# Altium project uECG.PrjPcb
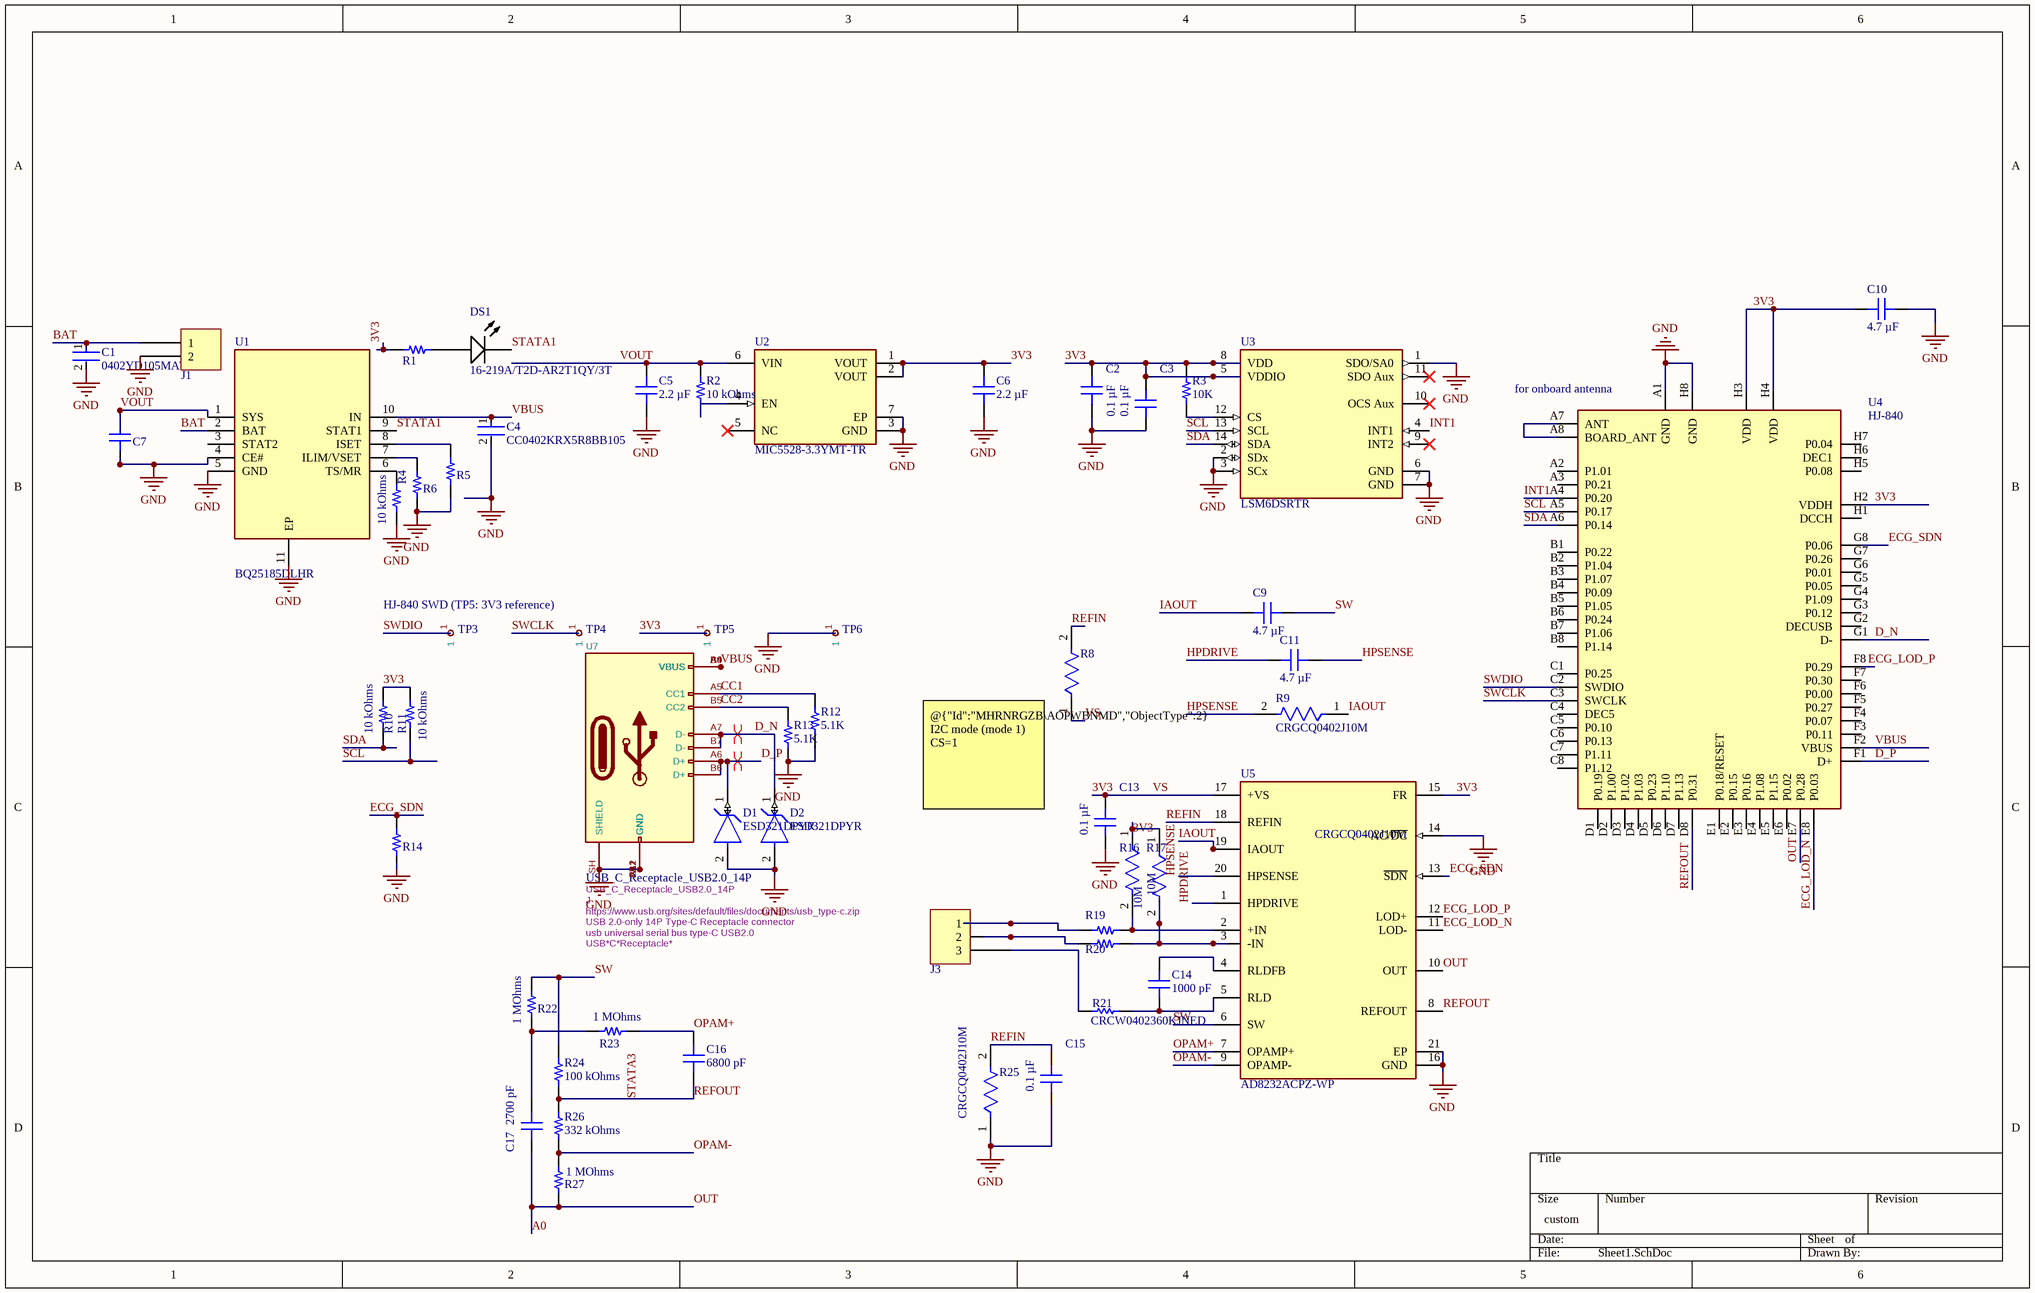
[diagram p0: Sheet1.SchDoc]
1 sheet, 54 parts. Net scope: global (net labels, ports and power ports of the same name join across sheets).
Board file: uECG.PcbDoc

## Sheet Sheet1.SchDoc
size 381 x 241 mm; SheetNumber: 1; SheetTotal: 1

### Parts
C1  0402YD105MAT2A  [FP-0402-L_1_0_1-W_0_5_0_1-MFG]
C2  0.1 µF  [CAP 0402_1005]
C3  0.1 µF  [CAP 0402_1005]
C4  CC0402KRX5R8BB105  [FP-CC0402-MFG]
C5  2.2 µF  [CAP 0603_1608]
C6  2.2 µF  [CAP 0603_1608]
C7  10 µF  [CAP 0603_1608]  (value not drawn)
C9  4.7 µF  [CAP 0402_1005]
C10  4.7 µF  [CAP 0402_1005]
C11  4.7 µF  [CAP 0402_1005]
C13  0.1 µF  [CAP 0402_1005]
C14  1000 pF  [CAP 0402_1005]
C15  0.1 µF  [CAP 0402_1005]
C16  6800 pF  [CAP 0402_1005]
C17  2700 pF  [CAP 0402_1005]
D1  ESD321DPYR  [FP-DPY0002A-MFG]
D2  ESD321DPYR  [FP-DPY0002A-MFG]
DS1  16-219A/T2D-AR2T1QY/3T  [EVRL-0402-2_V]
J1  0705530106  [MOLEX SDA-70553-2PIN]  (value not drawn)
J3  0705530002  [MOLEX SDA-70553-3PIN]  (value not drawn)
R1  1 kOhms  [RES 0402_1005]  (value not drawn)
R2  10 kOhms  [RES 0402_1005]
R3  10K  [RES 0402_1005]
R4  10 kOhms  [RES 0402_1005]
R5  3 kOhms  [RES 0402_1005]  (value not drawn)
R6  18 kOhms  [RES 0402_1005]  (value not drawn)
R8  CRGCQ0402J10M  [FP-CRGCQ0402-IPC_C]
R9  CRGCQ0402J10M  [FP-CRGCQ0402-IPC_C]
R10  10 kOhms  [RES 0402_1005]
R11  10 kOhms  [RES 0402_1005]
R12  5.1K  [RES 0402_1005]
R13  5.1K  [RES 0402_1005]
R14  100 kOhms  [RES 0402_1005]  (value not drawn)
R16  10M  [FP-CRGCQ0402-IPC_C]
R17  10M  [FP-CRGCQ0402-IPC_C]
R19  330 kOhms  [RES 0402_1005]  (value not drawn)
R20  330 kOhms  [RES 0402_1005]  (value not drawn)
R21  CRCW0402360KJNED  [RESC1005X40X25ML05T05]
R22  1 MOhms  [RES 0402_1005]
R23  1 MOhms  [RES 0402_1005]
R24  100 kOhms  [RES 0402_1005]
R25  CRGCQ0402J10M  [FP-CRGCQ0402-IPC_C]
R26  332 kOhms  [RES 0402_1005]
R27  1 MOhms  [RES 0402_1005]
TP3  TestPoint_Small  [TestPoint_Pad_D1.0mm]  (value not drawn)
TP4  TestPoint_Small  [TestPoint_Pad_D1.0mm]  (value not drawn)
TP5  TestPoint_Small  [TestPoint_Pad_D1.0mm]  (value not drawn)
TP6  TestPoint_Small  [TestPoint_Pad_D1.0mm]  (value not drawn)
U1  BQ25185DLHR  [WSON-10_L2.2-W2.0-P0.40-BL-EP_TI_DLH0010A]
U2  MIC5528-3.3YMT-TR  [FP-TDFN1212-6LD-PL-1-MFG]
U3  LSM6DSRTR  [FP-LGA-14L-DM00249496-MFG]
U4  HJ-840  [LGA-64_L7.0-W6.2-P0.90-R8-C8-S0.65-BL]
U5  AD8232ACPZ-WP  [FP-CP-20-8-IPC_A]
U7  USB_C_Receptacle_USB2.0_14P  Reference: J  ki_keywords: usb universal serial bus type-C USB2.0  ki_fp_filters: USB*C*Receptacle*  [USB_C_Receptacle_HRO_TYPE-C-31-M-12]

### Nets
GND: C1.2 C2.1 C3.1 C4.2 C5.1 C6.1 C7.1 C10.2 C13.1 C15.1 D1.2(GND) D2.2(GND) J1.2 R4.1 R5.1 R6.1 R12.1 R13.1 R14.1 R25.1 TP6.1 U1.4(CE#) U1.5(GND) U1.11(EP) U2.3(GND) U2.7(EP) U3.1(SDO/SA0) U3.2(SDx) U3.3(SCx) U3.6(GND) U3.7(GND) U4.A1(GND) U4.H8(GND) U5.14(AC/~{DC}) U5.16(GND) U5.21(EP) U7.A1(GND) U7.A12(GND) U7.B1(GND) U7.B12(GND) U7.SH(SHIELD)
3V3: C2.2 C3.2 C6.2 C10.1 C13.2 R1.1 R3.1 R8.1 R10.2 R11.2 R16.1 R17.1 TP5.1 U2.1(VOUT) U2.2(VOUT) U3.5(VDDIO) U3.8(VDD) U4.H2(VDDH) U4.H3(VDD) U4.H4(VDD) U5.15(FR) U5.17(+VS)  [also labelled VS]
A0: C17.1 R27.1 U4.E7(P0.28) U5.10(OUT)  [also labelled OUT]
BAT: C1.1 J1.1 U1.2(BAT)
CC1: R12.2 U7.A5(CC1)
CC2: R13.2 U7.B5(CC2)
D_N: D2.1(IO) U4.G1(D-) U7.A7(D-) U7.B7(D-)
D_P: D1.1(IO) U4.F1(D+) U7.A6(D+) U7.B6(D+)
ECG_LOD_N: U4.E8(P0.03) U5.11(LOD-)
ECG_LOD_P: U4.F8(P0.29) U5.12(LOD+)
ECG_SDN: R14.2 U4.G8(P0.06) U5.13(~{SDN})
HPDRIVE: C11.1 U5.1(HPDRIVE)
HPSENSE: C11.2 R9.2 U5.20(HPSENSE)
IAOUT: C9.1 R9.1 U5.19(IAOUT)
INT1: U3.4(INT1) U4.A4(P0.20)
OPAM+: C16.2 R23.2 U5.7(OPAMP+)
OPAM-: R26.1 R27.2 U5.9(OPAMP-)
REFIN: C15.2 R8.2 R25.2 U5.18(REFIN)
REFOUT: C16.1 R24.1 R26.2 U4.D8(P0.31) U5.8(REFOUT)  [also labelled STATA3]
SCL: R11.1 U3.13(SCL) U4.A5(P0.17)
SDA: R10.1 U3.14(SDA) U4.A6(P0.14)
STATA1: DS1.2(K) U1.9(STAT1)
SW: C9.2 R22.2 R24.2 U5.6(SW)
SWCLK: TP4.1 U4.C3(SWCLK)
SWDIO: TP3.1 U4.C2(SWDIO)
VBUS: C4.1 U1.10(IN) U4.F2(VBUS) U7.A4(VBUS) U7.A9(VBUS) U7.B4(VBUS) U7.B9(VBUS)
VOUT: C5.2 C7.2 R2.2 U1.1(SYS) U2.6(VIN)
NetC14_1: C14.1 R21.1 U5.5(RLD)
NetC14_2: C14.2 U5.4(RLDFB)
NetC17_2: C17.2 R22.1 R23.1
NetDS1_1: DS1.1(A) R1.2
NetJ3_1: J3.1 R19.1
NetJ3_2: J3.2 R20.1
NetJ3_3: J3.3 R21.2
NetR2_1: R2.1 U2.4(EN)
NetR3_2: R3.2 U3.12(CS)
NetR4_2: R4.2 U1.6(TS/MR)
NetR5_2: R5.2 U1.8(ISET)
NetR6_2: R6.2 U1.7(ILIM/VSET)
NetR16_2: R16.2 R19.2 U5.2(+IN)
NetR17_2: R17.2 R20.2 U5.3(-IN)
NetU4_A7: U4.A7(ANT) U4.A8(BOARD_ANT)

Not connected (* = marked no-connect by the designer): U1 3(STAT2); U2 5(NC)*; U3 9(INT2)* 10(OCS_Aux)* 11(SDO_Aux)*; U4 A2(P1.01) A3(P0.21) B1(P0.22) B2(P1.04) B3(P1.07) B4(P0.09) B5(P1.05) B6(P0.24) B7(P1.06) B8(P1.14) C1(P0.25) C4(DEC5) C5(P0.10) C6(P0.13) C7(P1.11) C8(P1.12) D1(P0.19) D2(P1.00) D3(P1.02) D4(P1.03) D5(P0.23) D6(P1.10) D7(P1.13) E1(P0.18/RESET) E2(P0.15) E3(P0.16) E4(P1.08) E5(P1.15) E6(P0.02) F3(P0.11) F4(P0.07) F5(P0.27) F6(P0.00) F7(P0.30) G2(DECUSB) G3(P0.12) G4(P1.09) G5(P0.05) G6(P0.01) G7(P0.26) H1(DCCH) H5(P0.08) H6(DEC1) H7(P0.04)

### Layout directives
differential pair: D_N, D_P

### Notes on the sheet
- (near U4) for onboard antenna
- HJ-840 SWD (TP5: 3V3 reference)
- (near R8) @{"Id":"MHRNRGZB\AOPWBNMD","ObjectType":2} I2C mode (mode 1) CS=1

### Library data of the parts
C1 = CMP-04427-002736-1: General Purpose Ceramic Capacitor, 0402, 1uF, 20%, X5R, 15%, 16V; Tolerance: 20%; Case/Package: 0402; Min Operating Temperature: -55°C; Packaging: Tape and Reel; Dielectric: X5R; Capacitance: 1uF; Max Operating Temperature: 85°C; RoHS Compliant: Yes; Voltage Rating (DC): 16V; Package Quantity: 10000
C2 C3 C13 C15 = CL05B104KP5VPNC: CAP CER 100NF 10V X7R 0402; manufacturer: Samsung Electro-Mechanics; Tolerance: ±10%; Part Number: CL05B104KP5VPNC; Capacitance: 0.1 µF; Applications: Automotive; componentlink1description: Datasheet; componentlink1url: https://mm.digikey.com/Volume0/opasdata/d220001/medias/docus/5458/CL05B104KP5VPNC_Spec.pdf; componentlink2description: DigiKey Link; componentlink2url: https://www.digikey.com/en/products/detail/samsung-electro-mechanics/CL05B104KP5VPNC/20498482; Device Package: 0402 (1005 Metric); Features: General Purpose; lastupdated: 06-04-2026 19:07:45; Lifecycle Status: Active; Minimum Order: 1; Mounting Type: Surface Mount, MLCC, Epoxy; Operating Temperature: -55°C ~ 125°C; Package / Case: 0402 (1005 Metric); packaging: TapeAndReel; partid: 56690; price: 0.01; Ratings: AEC-Q200; series: CL; Size / Dimension: 0.039" L x 0.020" W (1.00mm x 0.50mm); Supplier 1: DigiKey; Supplier Part Number 1: 1276-CL05B104KP5VPNCCT-ND; Temperature Coefficient: X7R; Thickness (Max): 0.022" (0.55mm); value: 0.1 µF; Voltage - Rated: 10V
C4 = CMP-03422-000114-1: CAP CER 1UF 25V X5R 0402; Manufacturer: YAGEO; Automotive Grade: NA; Tolerance: 0.1; Material: Ceramic; Temperature Coefficient: 30ppm/°C; RoHS: TRUE; Voltage Rating: 25 V; Footprint Url: http://www.yageo.com/exep/pages/download/literatures/UPY-C_GEN_24.pdf; Height: 0.55mm; Package: CC0402; Lead Free: Yes; Category: Cap; Device Class L1: Passive Components; ComponentLink2Description: Datasheet; Manufacturer Part Number: CC0402KRX5R8BB105; Value: 1 uF; Automotive: No; Capacitance: 1 uF; Temperature Characteristic: X5R; Temperature Range High: +125°C; Device Class L2: Capacitors; ComponentLink2URL: http://www.yageo.com/documents/recent/UPY-GP_NP0_16V-to-50V_16.pdf; Temperature Range Low: -55°C; Temperature: -55°C to +125°C; Ipc Land Pattern Name: CAPC10050X50; Device Class L3: Ceramic Capacitors; Digikey Description: CAP CER 1UF 25V X5R 0402; Octopart: https://octopart.com/cc0402krx5r8bb105-yageo-57080749; Mouser Description: Multilayer Ceramic Capacitors MLCC - SMD/SMT 1M pF 10% 25 Volts
C5 C6 = GRM188R61E225KA12D: CAP CER 2.2UF 16V X5R 0402; Part Number: CL05A225KO5NQNC; manufacturer: Samsung Electro-Mechanics; Tolerance: ±10%; id: 34; Capacitance: 2.2 µF; Applications: General Purpose; componentlink1description: Datasheet; componentlink1url: http://www.samsungsem.com/kr/support/product-search/mlcc/CL05A225KO5NQNC.jsp; componentlink2description: DigiKey Link; componentlink2url: https://www.digikey.com/en/products/detail/samsung-electro-mechanics/CL05A225KO5NQNC/3887119; Device Package: 0402 (1005 Metric); lastupdated: 2023-01-03T20:04:20.330; Lifecycle Status: Active; Minimum Order: 1; Mounting Type: Surface Mount, MLCC; Operating Temperature: -55°C ~ 85°C; Package / Case: 0402 (1005 Metric); packaging: TapeAndReel; partid: 1761; Part Status: Active; price: 0.03; series: CL; Size / Dimension: 0.039" L x 0.020" W (1.00mm x 0.50mm); Supplier 1: DigiKey; Supplier Part Number 1: 1276-1461-1-ND; Temperature Coefficient: X5R; Thickness (Max): 0.022" (0.55mm); value: 2.2 µF; Voltage - Rated: 16V
C7 = TMK107BBJ106MA-T: CAP CER 10UF 25V X5R 0603; Manufacturer: Taiyo Yuden; id: 1600; Tolerance: ±20%; Part Number: TMK107BBJ106MA-T; Value: 10 µF; Temperature Coefficient: X5R; Supplier Part Number 1: 587-6023-1-ND; ComponentLink2Description: DigiKey Link; ComponentLink1URL: https://ds.yuden.co.jp/TYCOMPAS/ut/detail?pn=TMK107BBJ106MA-T &u=M; PartId: 8967; Supplier 1: DigiKey; Series: M; LastUpdated: 2023-01-03T20:07:28.623; Part Status: Active; Capacitance: 10 µF; Device Package: 0603 (1608 Metric); Thickness (Max): 0.039" (1.00mm); Voltage - Rated: 25V; Minimum Order: 1; Packaging: TapeAndReel; Applications: SMPS Filtering; Package / Case: 0603 (1608 Metric); ComponentLink1Description: Datasheet; Price: 0.07; ComponentLink2URL: https://www.digikey.com/en/products/detail/taiyo-yuden/TMK107BBJ106MA-T/7403921; Lifecycle Status: Active; Operating Temperature: -55°C ~ 85°C; Size / Dimension: 0.063" L x 0.031" W (1.60mm x 0.80mm); Mounting Type: Surface Mount, MLCC
C9-C11 = CL05A475MO5NUNC: CAP CER 4.7UF 16V X5R 0402; manufacturer: Samsung Electro-Mechanics; Tolerance: ±20%; Part Number: CL05A475MO5NUNC; Capacitance: 4.7 µF; Applications: General Purpose; componentlink1description: Datasheet; componentlink1url: http://www.samsungsem.com/kr/support/product-search/mlcc/__icsFiles/afieldfile/2019/05/29/Data%20sheet_CL05A475MO5NUNC.pdf; componentlink2description: DigiKey Link; componentlink2url: https://www.digikey.com/en/products/detail/samsung-electro-mechanics/CL05A475MO5NUNC/5961320; Device Package: 0402 (1005 Metric); lastupdated: 06-04-2026 19:11:12; Lifecycle Status: Active; Minimum Order: 1; Mounting Type: Surface Mount, MLCC; Operating Temperature: -55°C ~ 85°C; Package / Case: 0402 (1005 Metric); packaging: TapeAndReel; partid: 1760; Part Status: Active; price: 0.07; series: CL; Size / Dimension: 0.039" L x 0.020" W (1.00mm x 0.50mm); Supplier 1: DigiKey; Supplier Part Number 1: 1276-6836-1-ND; Temperature Coefficient: X5R; Thickness (Max): 0.028" (0.70mm); value: 4.7 µF; Voltage - Rated: 16V
C14 = C0402C102K1GECAUTO: CAP CER 0402 1NF 100V C0G 10%; manufacturer: KEMET; Temperature Coefficient: C0G, NP0; Part Number: C0402C102K1GECAUTO; Capacitance: 1000 pF; Applications: Automotive, ESD Protection; componentlink1description: Datasheet; componentlink1url: https://api.kemet.com/component-edge/download/datasheet/C0402C102K1GECAUTO.pdf; componentlink2description: DigiKey Link; componentlink2url: https://www.digikey.com/en/products/detail/kemet/C0402C102K1GECAUTO/8563696; Device Package: 0402 (1005 Metric); Features: Low ESL, Low ESR; lastupdated: 06-04-2026 19:10:35; Lifecycle Status: Active; Minimum Order: 1; Mounting Type: Surface Mount, MLCC; Operating Temperature: -55°C ~ 125°C; Package / Case: 0402 (1005 Metric); packaging: TapeAndReel; partid: 10371; Part Status: Active; price: 0.02; Ratings: AEC-Q200; series: ESD SMD Auto C0G; Size / Dimension: 0.039" L x 0.020" W (1.00mm x 0.50mm); Supplier 1: DigiKey; Supplier Part Number 1: 399-17168-1-ND; Thickness (Max): 0.022" (0.55mm); Tolerance: ±10%; value: 1000 pF; Voltage - Rated: 100V
C16 = C0402C682K5RECAUTO: CAP CER 0402 6.8NF 50V X7R 10%; manufacturer: KEMET; Part Number: C0402C682K5RECAUTO; Capacitance: 6800 pF; Applications: Automotive, ESD Protection; componentlink1description: Datasheet; componentlink1url: https://api.kemet.com/component-edge/download/datasheet/C0402C682K5RECAUTO.pdf; componentlink2description: DigiKey Link; componentlink2url: https://www.digikey.com/en/products/detail/kemet/C0402C682K5RECAUTO/8646476; Device Package: 0402 (1005 Metric); lastupdated: 06-04-2026 19:10:09; Lifecycle Status: Active; Minimum Order: 1; Mounting Type: Surface Mount, MLCC; Operating Temperature: -55°C ~ 125°C; Package / Case: 0402 (1005 Metric); packaging: TapeAndReel; partid: 33549; Part Status: Active; price: 0.01; Ratings: AEC-Q200; series: ESD SMD Auto X7R; Size / Dimension: 0.039" L x 0.020" W (1.00mm x 0.50mm); Supplier 1: DigiKey; Supplier Part Number 1: 399-C0402C682K5RECAUTOCT-ND; Temperature Coefficient: X7R; Thickness (Max): 0.022" (0.55mm); Tolerance: ±10%; value: 6800 pF; Voltage - Rated: 50V
C17 = C0402C272K4RAC7867: CAP CER 2700PF 16V X7R 0402; manufacturer: KEMET; Tolerance: ±10%; Part Number: C0402C272K4RAC7867; Capacitance: 2700 pF; Applications: Bypass, Decoupling; componentlink1description: Datasheet; componentlink1url: https://api.kemet.com/component-edge/download/datasheet/C0402C272K4RACTU.pdf; componentlink2description: DigiKey Link; componentlink2url: https://www.digikey.com/en/products/detail/kemet/C0402C272K4RAC7867/2196549; Device Package: 0402 (1005 Metric); lastupdated: 06-04-2026 19:11:02; Lifecycle Status: Active; Minimum Order: 1; Mounting Type: Surface Mount, MLCC; Operating Temperature: -55°C ~ 125°C; Package / Case: 0402 (1005 Metric); packaging: TapeAndReel; partid: 3725; Part Status: Active; price: 0.06; series: SMD Comm X7R; Size / Dimension: 0.039" L x 0.020" W (1.00mm x 0.50mm); Supplier 1: DigiKey; Supplier Part Number 1: 399-17379-1-ND; Temperature Coefficient: X7R; Thickness (Max): 0.022" (0.55mm); value: 2700 pF; Voltage - Rated: 16V
D1 D2 = CMP-04989-000001-1: HDMI2.0 ESD PROTECTION; Manufacturer: Texas Instruments; Standoff Height: 0mm; Peak Pulse Current: 6A; Value: 0.9pF; Number Of Channels: 1; Reverse Standoff Voltage: 3.6V; Peak Pulse Power: 40W; Breakdown Voltage: 4.5V; Direction: Unidirectional; Clamping Voltage: 6.8V; RoHS: TRUE; Temperature: -40°C to +125°C; Package: DPY0002A; Temperature Range Low: -40°C; Temperature Range High: +125°C; Category: Diode; Capacitance: 0.9pF; Ambient Temperature Range Low: -40°C; Device Class L3: unset; Device Class L1: Circuit Protection; Ambient Temperature Range High: +125°C; ComponentLink2URL: http://www.ti.com/lit/ds/symlink/esd321.pdf; Octopart: https://octopart.com/esd321dpyr-texas+instruments-94354200; Manufacturer Part Number: ESD321DPYR; Digikey Description: HDMI2.0 ESD PROTECTION; Lead Free: Yes; ComponentLink2Description: Datasheet; Device Class L2: TVS Diodes; Height: 0.45mm; Automotive: No
DS1 = CMP-2100-03575-1: Chip LED, White, 5 V, 10 mA, 30 mW, -40 to 85 degC, 2-Pin SMD (0402), RoHS, Tape and Reel; Manufacturer: Everlight Electronics; Power Rating: 30mW; Luminous Intensity: 360mcd; Forward Current: 5mA; Forward Voltage: 2.6V; Lens Colour: Yellow; Viewing Angle: 130degrees; Min Operating Temperature: -40degC; Datasheet URL: http://www.everlight.com/file/ProductFile/16-219A-T2D-AR2T1QY-3T.pdf; Case/Package: 0402; Package Description: 2-Pin Surface Mount Device, Body 1 x 0.5 mm; RoHSCompliant: true; Datasheet Version: Rev. 5, 04/2013; Max Operating Temperature: 85degC; Packaging: TapeandReel; Package Reference: 0402; Package Quantity: 3000; Manufacturer URL: http://www.everlight.com/; Illumination Colour: White; Mount: Standard
J1 = 0705530106: CONN HEADER R/A 2POS 2.54MM; Manufacturer: Molex; id: 85; Style: Board to Cable/Wire; Contact Length - Mating: 0.240" (6.10mm); Pitch - Mating: 0.100" (2.54mm); Number Of Positions: 2; Number Of Positions Loaded: All; Voltage Rating: 250V; Shrouding: Shrouded - 4 Wall; Material Flammability Rating: UL94 V-0; Contact Length - Post: 0.130" (3.30mm); Part Number: 0705530106; Supplier Part Number 1: WM4153-ND; Contact Shape: Square; Termination: Solder; ComponentLink1Description: Datasheet; Connector Type: Header; Contact Material: Phosphor Bronze; ComponentLink2URL: http://digikey.com/product-detail/en/molex/0705530106/WM4153-ND/1643386; Contact Finish - Mating: Gold; ComponentLink1URL: https://www.molex.com/pdm_docs/sd/705530106_sd.pdf; Fastening Type: Latch Holder; Supplier 1: DigiKey; Number Of Rows: 1; Series: SL 70553; Part Status: Active; ComponentLink2Description: DigiKey Link; Contact Type: Male Pin; Packaging: Tube; Insulation Height: 0.215" (5.45mm); Contact Finish - Post: Tin; Contact Finish Thickness - Mating: 30.0µin (0.76µm); Minimum Order: 1; PartId: 85; Lifecycle Status: Active; LastUpdated: 2020-01-12T23:55:40.060; Operating Temperature: -40°C ~ 105°C; Insulation Color: Black; Mounting Type: Through Hole, Right Angle; Insulation Material: Polyester, Glass Filled; Price: 1.38
J3 = 0705530002: CONN HEADER R/A 3POS 2.54MM; Manufacturer: Molex; id: 86; Style: Board to Cable/Wire; Contact Length - Mating: 0.240" (6.10mm); Pitch - Mating: 0.100" (2.54mm); Number Of Positions: 3; Number Of Positions Loaded: All; Voltage Rating: 250V; Shrouding: Shrouded - 4 Wall; Material Flammability Rating: UL94 V-0; Contact Length - Post: 0.130" (3.30mm); Part Number: 0705530002; Supplier Part Number 1: WM4901-ND; Contact Shape: Square; Termination: Solder; ComponentLink1Description: Datasheet; Connector Type: Header; Contact Material: Phosphor Bronze; ComponentLink2URL: http://digikey.com/product-detail/en/molex/0705530002/WM4901-ND/114955; Contact Finish - Mating: Gold; ComponentLink1URL: https://www.molex.com/pdm_docs/sd/705530002_sd.pdf; Fastening Type: Latch Holder; Supplier 1: DigiKey; Number Of Rows: 1; Series: SL 70553; Part Status: Active; ComponentLink2Description: DigiKey Link; Contact Type: Male Pin; Packaging: Tube; Insulation Height: 0.215" (5.45mm); Contact Finish - Post: Tin; Contact Finish Thickness - Mating: 15.0µin (0.38µm); Minimum Order: 1; PartId: 86; Lifecycle Status: Active; LastUpdated: 2020-01-12T23:55:55.763; Operating Temperature: -40°C ~ 105°C; Insulation Color: Black; Mounting Type: Through Hole, Right Angle; Insulation Material: Polyester, Glass Filled; Price: 1.02
R1 = CPF0402B1K0E: RES SMD 1K OHM 0.1% 1/16W 0402; Manufacturer: TE Connectivity Passive Product; id: 25; Temperature Coefficient: ±25ppm/°C; Power (Watts): 0.063W, 1/16W; Part Number: CPF0402B1K0E; Height - Seated (Max): 0.014" (0.35mm); Supplier Part Number 1: A119928CT-ND; Supplier Device Package: 0402; ComponentLink1Description: Datasheet; ComponentLink2URL: https://www.digikey.com/en/products/detail/te-connectivity-passive-product/CPF0402B1K0E/4966468; ComponentLink1URL: https://www.te.com/commerce/DocumentDelivery/DDEController?Action=srchrtrv&DocNm=1773200&DocType=DS&DocLang=English; Composition: Thin Film; Tolerance: ±0.1%; Supplier 1: DigiKey; Series: CPF, Neohm; Part Status: Active; ComponentLink2Description: DigiKey Link; Device Package: 0402 (1005 Metric); Packaging: TapeAndReel; Minimum Order: 1; Package / Case: 0402 (1005 Metric); PartId: 2470; Lifecycle Status: Active; LastUpdated: 2023-01-02T20:21:51.393; Operating Temperature: -55°C ~ 155°C; Number Of Terminations: 2; Value: 1 kOhms; Size / Dimension: 0.039" L x 0.020" W (1.00mm x 0.50mm); Price: 0.10; Resistance: 1 kOhms
R2 R10 R11 = RT0402FRE0710KL: RES 10K OHM 0.1% 1/10W 0402; Part Number: RP73PF1E10KBTD; Manufacturer: TE Connectivity Passive Product; Power (Watts): 0.1W, 1/10W; Temperature Coefficient: ±25ppm/°C; id: 8; Value: 10 kOhms; ComponentLink1Description: Datasheet; ComponentLink1URL: https://www.te.com/commerce/DocumentDelivery/DDEController?Action=srchrtrv&DocNm=1773272&DocType=DS&DocLang=English; ComponentLink2Description: DigiKey Link; ComponentLink2URL: https://www.digikey.com/en/products/detail/te-connectivity-passive-product/RP73PF1E10KBTD/8260957; Composition: Thin Film; Device Package: 0402 (1005 Metric); Height - Seated (Max): 0.014" (0.35mm); LastUpdated: 2023-01-02T20:21:51.543; Lifecycle Status: Active; Minimum Order: 1; Number of Terminations: 2; Operating Temperature: -55°C ~ 155°C; Package / Case: 0402 (1005 Metric); Packaging: TapeAndReel; PartId: 2434; Part Status: Active; Price: 0.08; Resistance: 10 kOhms; Series: RP73, Holsworthy; Size / Dimension: 0.039" L x 0.020" W (1.00mm x 0.50mm); Supplier 1: DigiKey; Supplier Part Number 1: A127415CT-ND; Supplier Device Package: 0402; Tolerance: ±0.1%
R3 = AC0402JR-0710KL: RES SMD 10K OHM 5% 1/16W 0402; Manufacturer: Yageo; Power (Watts): 0.063W, 1/16W; Resistance: 10 kOhms; Temperature Coefficient: ±100ppm/°C; Part Number: AC0402JR-0710KL; Value: 10K; ComponentLink1Description: Datasheet; ComponentLink1URL: https://www.yageo.com/upload/media/product/productsearch/datasheet/rchip/PYu-AC_51_RoHS_L_7.pdf; ComponentLink2Description: DigiKey Link; ComponentLink2URL: https://www.digikey.com/en/products/detail/yageo/AC0402JR-0710KL/5895571; Composition: Thick Film; Device Package: 0402 (1005 Metric); Features: Automotive AEC-Q200, Moisture Resistant; Height - Seated (Max): 0.015" (0.37mm); LastUpdated: 06-04-2026 19:41:17; Lifecycle Status: Active; Minimum Order: 1; Number of Terminations: 2; Operating Temperature: -55°C ~ 155°C; Package / Case: 0402 (1005 Metric); Packaging: CutTape; PartId: 3376; Part Status: Active; Price: 0.01; Ratings: AEC-Q200; Series: AC; Size / Dimension: 0.039" L x 0.020" W (1.00mm x 0.50mm); Supplier 1: DigiKey; Supplier Part Number 1: YAG3517CT-ND; Supplier Device Package: 0402; Tolerance: ±5%
R4 = AC0402JR-0710KL: RES 10K OHM 0.1% 1/10W 0402; Part Number: RP73PF1E10KBTD; Manufacturer: TE Connectivity Passive Product; Power (Watts): 0.1W, 1/10W; Temperature Coefficient: ±25ppm/°C; id: 8; Value: 10 kOhms; ComponentLink1Description: Datasheet; ComponentLink1URL: https://www.te.com/commerce/DocumentDelivery/DDEController?Action=srchrtrv&DocNm=1773272&DocType=DS&DocLang=English; ComponentLink2Description: DigiKey Link; ComponentLink2URL: https://www.digikey.com/en/products/detail/te-connectivity-passive-product/RP73PF1E10KBTD/8260957; Composition: Thin Film; Device Package: 0402 (1005 Metric); Height - Seated (Max): 0.014" (0.35mm); LastUpdated: 2023-01-02T20:21:51.543; Lifecycle Status: Active; Minimum Order: 1; Number of Terminations: 2; Operating Temperature: -55°C ~ 155°C; Package / Case: 0402 (1005 Metric); Packaging: TapeAndReel; PartId: 2434; Part Status: Active; Price: 0.08; Resistance: 10 kOhms; Series: RP73, Holsworthy; Size / Dimension: 0.039" L x 0.020" W (1.00mm x 0.50mm); Supplier 1: DigiKey; Supplier Part Number 1: A127415CT-ND; Supplier Device Package: 0402; Tolerance: ±0.1%
R5 = RC0402FR-073KL: RES 3K OHM 1% 1/16W 0402; Manufacturer: Yageo; id: 33; Temperature Coefficient: ±100ppm/°C; Power (Watts): 0.063W, 1/16W; Part Number: RC0402FR-073KL; Height - Seated (Max): 0.016" (0.40mm); Supplier Part Number 1: 311-3KLRCT-ND; Supplier Device Package: 0402; ComponentLink1Description: Datasheet; ComponentLink2URL: https://www.digikey.com/en/products/detail/yageo/RC0402FR-073KL/2827586; Features: Moisture Resistant; ComponentLink1URL: https://www.yageo.com/upload/media/product/productsearch/datasheet/rchip/PYu-RC_Group_51_RoHS_L_10.pdf; Composition: Thick Film; Tolerance: ±1%; Supplier 1: DigiKey; Series: RC_L; Part Status: Active; ComponentLink2Description: DigiKey Link; Device Package: 0402 (1005 Metric); Packaging: CutTape; Minimum Order: 1; Package / Case: 0402 (1005 Metric); PartId: 2489; Lifecycle Status: Active; LastUpdated: 2023-01-02T20:21:51.323; Operating Temperature: -55°C ~ 155°C; Number Of Terminations: 2; Value: 3 kOhms; Size / Dimension: 0.039" L x 0.020" W (1.00mm x 0.50mm); Price: 0.01; Resistance: 3 kOhms
R6 = RC0402FR-0718KL: RES 18K OHM 1% 1/16W 0402; Manufacturer: Yageo; id: 68; Temperature Coefficient: ±100ppm/°C; Power (Watts): 0.063W, 1/16W; Part Number: RC0402FR-0718KL; Height - Seated (Max): 0.016" (0.40mm); Supplier Part Number 1: 311-18.0KLRCT-ND; Supplier Device Package: 0402; ComponentLink1Description: Datasheet; ComponentLink2URL: https://www.digikey.com/en/products/detail/yageo/RC0402FR-0718KL/726548; Features: Moisture Resistant; ComponentLink1URL: https://www.yageo.com/upload/media/product/productsearch/datasheet/rchip/PYu-RC_Group_51_RoHS_L_10.pdf; Composition: Thick Film; Tolerance: ±1%; Supplier 1: DigiKey; Series: RC_L; Part Status: Active; ComponentLink2Description: DigiKey Link; Device Package: 0402 (1005 Metric); Packaging: CutTape; Minimum Order: 1; Package / Case: 0402 (1005 Metric); PartId: 2565; Lifecycle Status: Active; LastUpdated: 2023-01-02T20:21:51.053; Operating Temperature: -55°C ~ 155°C; Number Of Terminations: 2; Value: 18 kOhms; Size / Dimension: 0.039" L x 0.020" W (1.00mm x 0.50mm); Price: 0.01; Resistance: 18 kOhms
R8 R9 R25 = CMP-03211-005642-1: CRGCQ 0402 10M 5%; Manufacturer: TE Connectivity; Voltage Rating: 50V; Power Rating: 0.0625W; Value: 10MΩ; Tolerance: 0.05; Temperature Coefficient: ±100ppm/°C; Octopart: https://octopart.com/crgcq0402j10m-te+connectivity-91017994; Ipc Land Pattern Name: RESC10050X35; RoHS: TRUE; Digikey Description: CRGCQ 0402 10M 5%; Temperature Range High: +155°C; Device Class L3: Chip SMD Resistors; Temperature Range Low: -55°C; Height: 0.4mm; ComponentLink2Description: Datasheet; Device Class L1: Passive Components; Category: Res; Package: CRGCQ0402; Temperature: -55°C to +155°C; ComponentLink2URL: https://www.te.com/commerce/DocumentDelivery/DDEController?Action=showdoc&DocId=Data+Sheet%7F1773204-3%7F1%7Fpdf%7FEnglish%7FENG_DS_1773204-3_1.pdf%7F4-2176347-1607; Device Class L2: Resistors; Composition: Thick Film; Automotive: Yes; Series: CRGCQ; Resistance: 10MΩ; Lead Free: Yes; Manufacturer Part Number: CRGCQ0402J10M; Ambient Temperature Range High: +70°C
R12 R13 = AC0402JR-075K1L: RES SMD 5.1K OHM 5% 1/16W 0402; Manufacturer: Yageo; Power (Watts): 0.063W, 1/16W; Resistance: 5.1 kOhms; Temperature Coefficient: ±100ppm/°C; Part Number: AC0402JR-075K1L; Value: 5.1K; ComponentLink1Description: Datasheet; ComponentLink1URL: https://www.yageo.com/upload/media/product/productsearch/datasheet/rchip/PYu-AC_51_RoHS_L_7.pdf; ComponentLink2Description: DigiKey Link; ComponentLink2URL: https://www.digikey.com/en/products/detail/yageo/AC0402JR-075K1L/5895695; Composition: Thick Film; Device Package: 0402 (1005 Metric); Features: Automotive AEC-Q200, Moisture Resistant; Height - Seated (Max): 0.015" (0.37mm); LastUpdated: 06-04-2026 19:41:15; Lifecycle Status: Active; Minimum Order: 1; Number of Terminations: 2; Operating Temperature: -55°C ~ 155°C; Package / Case: 0402 (1005 Metric); Packaging: CutTape; PartId: 4690; Part Status: Active; Price: 0.01; Ratings: AEC-Q200; Series: AC; Size / Dimension: 0.039" L x 0.020" W (1.00mm x 0.50mm); Supplier 1: DigiKey; Supplier Part Number 1: YAG3554CT-ND; Supplier Device Package: 0402; Tolerance: ±5%
R14 = RP73PF1E100KBTD: RES 100K OHM 0.1% 1/10W 0402; Manufacturer: TE Connectivity Passive Product; id: 9; Temperature Coefficient: ±25ppm/°C; Power (Watts): 0.1W, 1/10W; Part Number: RP73PF1E100KBTD; Height - Seated (Max): 0.014" (0.35mm); Supplier Part Number 1: A127511CT-ND; Supplier Device Package: 0402; ComponentLink1Description: Datasheet; ComponentLink2URL: https://www.digikey.com/en/products/detail/te-connectivity-passive-product/RP73PF1E100KBTD/8261053; ComponentLink1URL: https://www.te.com/commerce/DocumentDelivery/DDEController?Action=srchrtrv&DocNm=1773272&DocType=DS&DocLang=English; Composition: Thin Film; Tolerance: ±0.1%; Supplier 1: DigiKey; Series: RP73, Holsworthy; Part Status: Active; ComponentLink2Description: DigiKey Link; Device Package: 0402 (1005 Metric); Packaging: TapeAndReel; Minimum Order: 1; Package / Case: 0402 (1005 Metric); PartId: 2436; Lifecycle Status: Active; LastUpdated: 2023-01-02T20:21:51.537; Operating Temperature: -55°C ~ 155°C; Number Of Terminations: 2; Value: 100 kOhms; Size / Dimension: 0.039" L x 0.020" W (1.00mm x 0.50mm); Price: 0.08; Resistance: 100 kOhms
R16 R17 = CMP-03211-005642-1: CRGCQ 0402 10M 5%; Manufacturer Part Number: CRGCQ0402J10M; Manufacturer: TE Connectivity; Voltage Rating: 50V; Power Rating: 0.0625W; Value: 10MΩ; Tolerance: 0.05; Temperature Coefficient: ±100ppm/°C; Octopart: https://octopart.com/crgcq0402j10m-te+connectivity-91017994; Ipc Land Pattern Name: RESC10050X35; RoHS: TRUE; Digikey Description: CRGCQ 0402 10M 5%; Temperature Range High: +155°C; Device Class L3: Chip SMD Resistors; Temperature Range Low: -55°C; Height: 0.4mm; ComponentLink2Description: Datasheet; Device Class L1: Passive Components; Category: Res; Package: CRGCQ0402; Temperature: -55°C to +155°C; ComponentLink2URL: https://www.te.com/commerce/DocumentDelivery/DDEController?Action=showdoc&DocId=Data+Sheet%7F1773204-3%7F1%7Fpdf%7FEnglish%7FENG_DS_1773204-3_1.pdf%7F4-2176347-1607; Device Class L2: Resistors; Composition: Thick Film; Automotive: Yes; Series: CRGCQ; Resistance: 10MΩ; Lead Free: Yes; Ambient Temperature Range High: +70°C
R19 R20 = RC0402FR-07330KL: RES 330K OHM 1% 1/16W 0402; Manufacturer: Yageo; id: 164; Temperature Coefficient: ±100ppm/°C; Power (Watts): 0.063W, 1/16W; Part Number: RC0402FR-07330KL; Height - Seated (Max): 0.016" (0.40mm); Supplier Part Number 1: 311-330KLRCT-ND; Supplier Device Package: 0402; ComponentLink1Description: Datasheet; ComponentLink2URL: https://www.digikey.com/en/products/detail/yageo/RC0402FR-07330KL/2827574; Features: Moisture Resistant; ComponentLink1URL: https://www.yageo.com/upload/media/product/productsearch/datasheet/rchip/PYu-RC_Group_51_RoHS_L_10.pdf; Composition: Thick Film; Tolerance: ±1%; Supplier 1: DigiKey; Series: RC_L; Part Status: Active; ComponentLink2Description: DigiKey Link; Device Package: 0402 (1005 Metric); Packaging: CutTape; Minimum Order: 1; Package / Case: 0402 (1005 Metric); PartId: 2765; Lifecycle Status: Active; LastUpdated: 2023-01-02T20:21:50.320; Operating Temperature: -55°C ~ 155°C; Number Of Terminations: 2; Value: 330 kOhms; Size / Dimension: 0.039" L x 0.020" W (1.00mm x 0.50mm); Price: 0.01; Resistance: 330 kOhms
R21 = CMP-2002-08545-1: Manufacturer: Vishay Dale; Part Number: CRCW0402360KJNED
R22 R23 R27 = AC0402JR-071ML: RES SMD 1M OHM 5% 1/16W 0402; Manufacturer: Yageo; id: 438; Temperature Coefficient: ±100ppm/°C; Power (Watts): 0.063W, 1/16W; Part Number: AC0402JR-071ML; Height - Seated (Max): 0.015" (0.37mm); Supplier Part Number 1: YAG3526CT-ND; Supplier Device Package: 0402; ComponentLink1Description: Datasheet; ComponentLink2URL: https://www.digikey.com/en/products/detail/yageo/AC0402JR-071ML/5895610; Features: Automotive AEC-Q200, Moisture Resistant; ComponentLink1URL: https://www.yageo.com/upload/media/product/productsearch/datasheet/rchip/PYu-AC_51_RoHS_L_7.pdf; Composition: Thick Film; Tolerance: ±5%; Supplier 1: DigiKey; Series: AC; Part Status: Active; ComponentLink2Description: DigiKey Link; Device Package: 0402 (1005 Metric); Packaging: CutTape; Ratings: AEC-Q200; Minimum Order: 1; Package / Case: 0402 (1005 Metric); PartId: 3387; Lifecycle Status: Active; LastUpdated: 2023-01-02T20:21:48.037; Operating Temperature: -55°C ~ 155°C; Number Of Terminations: 2; Value: 1 MOhms; Size / Dimension: 0.039" L x 0.020" W (1.00mm x 0.50mm); Price: 0.01; Resistance: 1 MOhms
R24 = CPF0402B100KE: RES SMD 100K OHM 0.1% 1/16W 0402; Manufacturer: TE Connectivity Passive Product; Power (Watts): 0.063W, 1/16W; Temperature Coefficient: ±25ppm/°C; Part Number: CPF0402B100KE; Value: 100 kOhms; ComponentLink1Description: Datasheet; ComponentLink1URL: https://www.te.com/commerce/DocumentDelivery/DDEController?Action=srchrtrv&DocNm=1773200&DocType=DS&DocLang=English; ComponentLink2Description: DigiKey Link; ComponentLink2URL: https://www.digikey.com/en/products/detail/te-connectivity-passive-product/CPF0402B100KE/4966480; Composition: Thin Film; Device Package: 0402 (1005 Metric); Height - Seated (Max): 0.014" (0.35mm); LastUpdated: 09-02-2024 20:30:24; Lifecycle Status: Active; Minimum Order: 1; Number of Terminations: 2; Operating Temperature: -55°C ~ 155°C; Package / Case: 0402 (1005 Metric); Packaging: TapeAndReel; PartId: 2472; Part Status: Active; Price: 0.10; Resistance: 100 kOhms; Series: CPF, Neohm; Size / Dimension: 0.039" L x 0.020" W (1.00mm x 0.50mm); Supplier 1: DigiKey; Supplier Part Number 1: A119916CT-ND; Supplier Device Package: 0402; Tolerance: ±0.1%
R26 = CRCW0603332KFKEAHP: RES SMD 332K OHM 1% 1/3W 0603; Manufacturer: Vishay Dale; Power (Watts): 0.333W, 1/3W; Temperature Coefficient: ±100ppm/°C; Part Number: CRCW0603332KFKEAHP; Value: 332 kOhms; ComponentLink1Description: Datasheet; ComponentLink1URL: http://www.vishay.com/docs/20043/crcwhpe3.pdf; ComponentLink2Description: DigiKey Link; ComponentLink2URL: https://www.digikey.com/en/products/detail/vishay-dale/CRCW0603332KFKEAHP/2226453; Composition: Thick Film; Device Package: 0603 (1608 Metric); Features: Automotive AEC-Q200, Pulse Withstanding; Height - Seated (Max): 0.022" (0.55mm); LastUpdated: 09-02-2024 20:43:29; Lifecycle Status: Active; Minimum Order: 1; Number of Terminations: 2; Operating Temperature: -55°C ~ 155°C; Package / Case: 0603 (1608 Metric); Packaging: TapeAndReel; PartId: 6710; Part Status: Active; Price: 0.02; Ratings: AEC-Q200; Resistance: 332 kOhms; Series: CRCW-HP; Size / Dimension: 0.063" L x 0.033" W (1.60mm x 0.85mm); Supplier 1: DigiKey; Supplier Part Number 1: 541-332KSCT-ND; Supplier Device Package: 0603; Tolerance: ±1%
TP3-TP6 = TestPoint_Small: test point
U1 = BQ25185DLHR: The Chip Type:Charging IC Voltage - Supply:3V~18V Voltage - Supply:3V~18V Charge Current - Max:1A Charging Saturation Voltage:4.4V End-Off Voltage:2.2V Type of Battery:Lithium Battery；LiFePO4 Battery Number of Cells:1 Number of Cells:1 Operating Temperatu; Manufacturer: TI(德州仪器); Voltage - Supply: 3V~18V; Charge Current - Max: 1A; Charging Saturation Voltage: 4.4V; End-Off Voltage: 2.2V; Number of Cells: 1; Battery Temperature Detection: Support; Supply Current (Iq): 4uA; LCSC Part Name: 单节1A独立线性电池充电器，具备电源路径、工厂模式和电池跟踪功能; Supplier Part: C19725033; Manufacturer Part: BQ25185DLHR; Supplier Footprint: WSON-10-EP(2.2x2); JLCPCB Part Class: Extended Part; Datasheet: https://www.ti.com.cn/cn/lit/ds/symlink/bq25185.pdf?ts=1739415017761&ref_url=https%253A%252F%252Fwww.ti.com.cn%252Fproduct%252Fcn%252FBQ25185%253FkeyMatch%253Dbq25185%2526tisearch%253Duniversal_search; Supplier: LCSC; The Chip Type: Charging IC; Type of Battery: Lithium Battery；LiFePO4 Battery; Operating Temperature: -40℃~+125℃
U2 = CMP-06324-000078-1: IC REG LINEAR 3.3V 500MA 6TDFN; Dropout Voltage: 260mV; Number of Regulators: 1; Min Current Limit: 525mA; Output Current: 500mA; Output Voltage: 3.3V; Max Operating Temperature: 125°C; Packaging: Tape and Reel; Mount: Surface Mount; Min Operating Temperature: -40°C
U3 = CMP-12177-000003-1: INEMO INERTIAL MODULE: 3D ACCELE; Manufacturer: STMicroelectronics; Sensor Output: I2C,SPI; Accel Range: 2/4/8/16g; Gyro Range: 125/250/500/1000/2000/4000°/s; Operating Supply Current: 360-1200uA; Max Supply Voltage: 3.6V; Min Supply Voltage: 1.62V; Sensor Type: Temperature,Accelerometer,Gyroscope; Device Class L3: Inertial Measurement Units (IMUs); Package: LGA-14L-DM00249496; ComponentLink2Description: Datasheet; Mouser Description: In a Pack of 2, LSM6DSRTR STMicroelectronics, 3-Axis Accelerometer, Gyroscope, 14-Pin LGA; Footprint Url: https://www.st.com/content/ccc/resource/technical/document/technical_note/73/17/9c/16/dd/96/4a/01/CD00134799.pdf/files/CD00134799.pdf/jcr:content/translations/en.CD00134799.pdf; RoHS: TRUE; Automotive: No; Temperature Range High: +85°C; Digikey Description: INEMO INERTIAL MODULE: 3D ACCELE; Manufacturer Part Number: LSM6DSRTR; ComponentLink2URL: https://www.st.com/resource/en/datasheet/lsm6dsr.pdf; Lead Free: Yes; Category: IC; Temperature Range Low: -40°C; Height: 0.86mm; Octopart: https://octopart.com/lsm6dsrtr-stmicroelectronics-93180177; Temperature: -40°C to +85°C; Device Class L1: Sensors; Device Class L2: Motion Sensors
U4 = HJ-840_C50052094: Utilized IC / Part:nRF52840 Interface Type:UART Wireless Standard:BLE5.4 Output Power(Max):8dBm Output Power(Max):8dBm Voltage - Supply:1.7V~5.5V Voltage - Supply:1.7V~5.5V Antenna Type:On-board PCB Antenna or External Antenna Receive  Current:4.6mA Send; Manufacturer: HJSIP(宏佳电子); Interface Type: UART; Wireless Standard: BLE5.4; Output Power(Max): 8dBm; Receive  Current: 4.6mA; Send  Current: 4.8mA; Communication Distance: 80m; Sensitivity: -95dBm; LCSC Part Name: HJ-840基于Nordic nRF52840的高性能、超薄型，小尺寸 6.2 × 7.0 × 0.9 mm含天线 BLE 5.4 芯片级SIP蓝牙模组; Supplier Part: C50052094; Manufacturer Part: HJ-840; Supplier Footprint: LGA-64(6.2x7); JLCPCB Part Class: Extended Part; Datasheet: https://item.szlcsc.com/datasheet/HJ-840/52617268.html; Supplier: LCSC; Utilized IC / Part: nRF52840; Voltage - Supply: 1.7V~5.5V; Antenna Type: On-board PCB Antenna or External Antenna; Operating Temperature: -40℃~+85℃; Features: Encryption function
U5 = CMP-09085-000022-1: IC ECG FRONT END 20LFCSP; Number of Channels: 1; Input Offset Voltage (Vos): 3mV; Slew Rate: 0.2V/µs; Min Supply Voltage: 2V; Power Supply Rejection Ratio (PSRR): 90dB; Max Supply Voltage: 3.5V; Input Bias Current: 200pA; Operating Supply Current: 170uA; Common Mode Rejection Ratio: 80dB; Gain Bandwidth Product: 100kHz; Packaging: Tray; RoHS Compliant: Yes; Radiation Hardening: No; Contact Plating: Tin; Number of Pins: 20; Width: 4.1mm; REACH SVHC: No SVHC; Mount: Surface Mount; Length: 4.1mm; Lead Free: Contains Lead; Case/Package: LFCSP EP; Min Operating Temperature: -40°C; Max Operating Temperature: 85°C; Height: 0.75mm; Series: -
U7 = USB_C_Receptacle_USB2.0_14P: USB 2.0-only 14P Type-C Receptacle connector; Value: USB_C_Receptacle_USB2.0_14P; Datasheet: https://www.usb.org/sites/default/files/documents/usb_type-c.zip; Description_: USB 2.0-only 14P Type-C Receptacle connector